# EasyEDA Pro project Orion S4 Schematic.epro

# Schematic Schematic1
Board Name: Board1; Create Date: 2026-10-31; Page Name: P1; Project Name: Orion S4 (3); Schematic Name: Schematic1; Update Date: 2026-10-31; Company: Orion; Page Size: A4; Version: V1.0
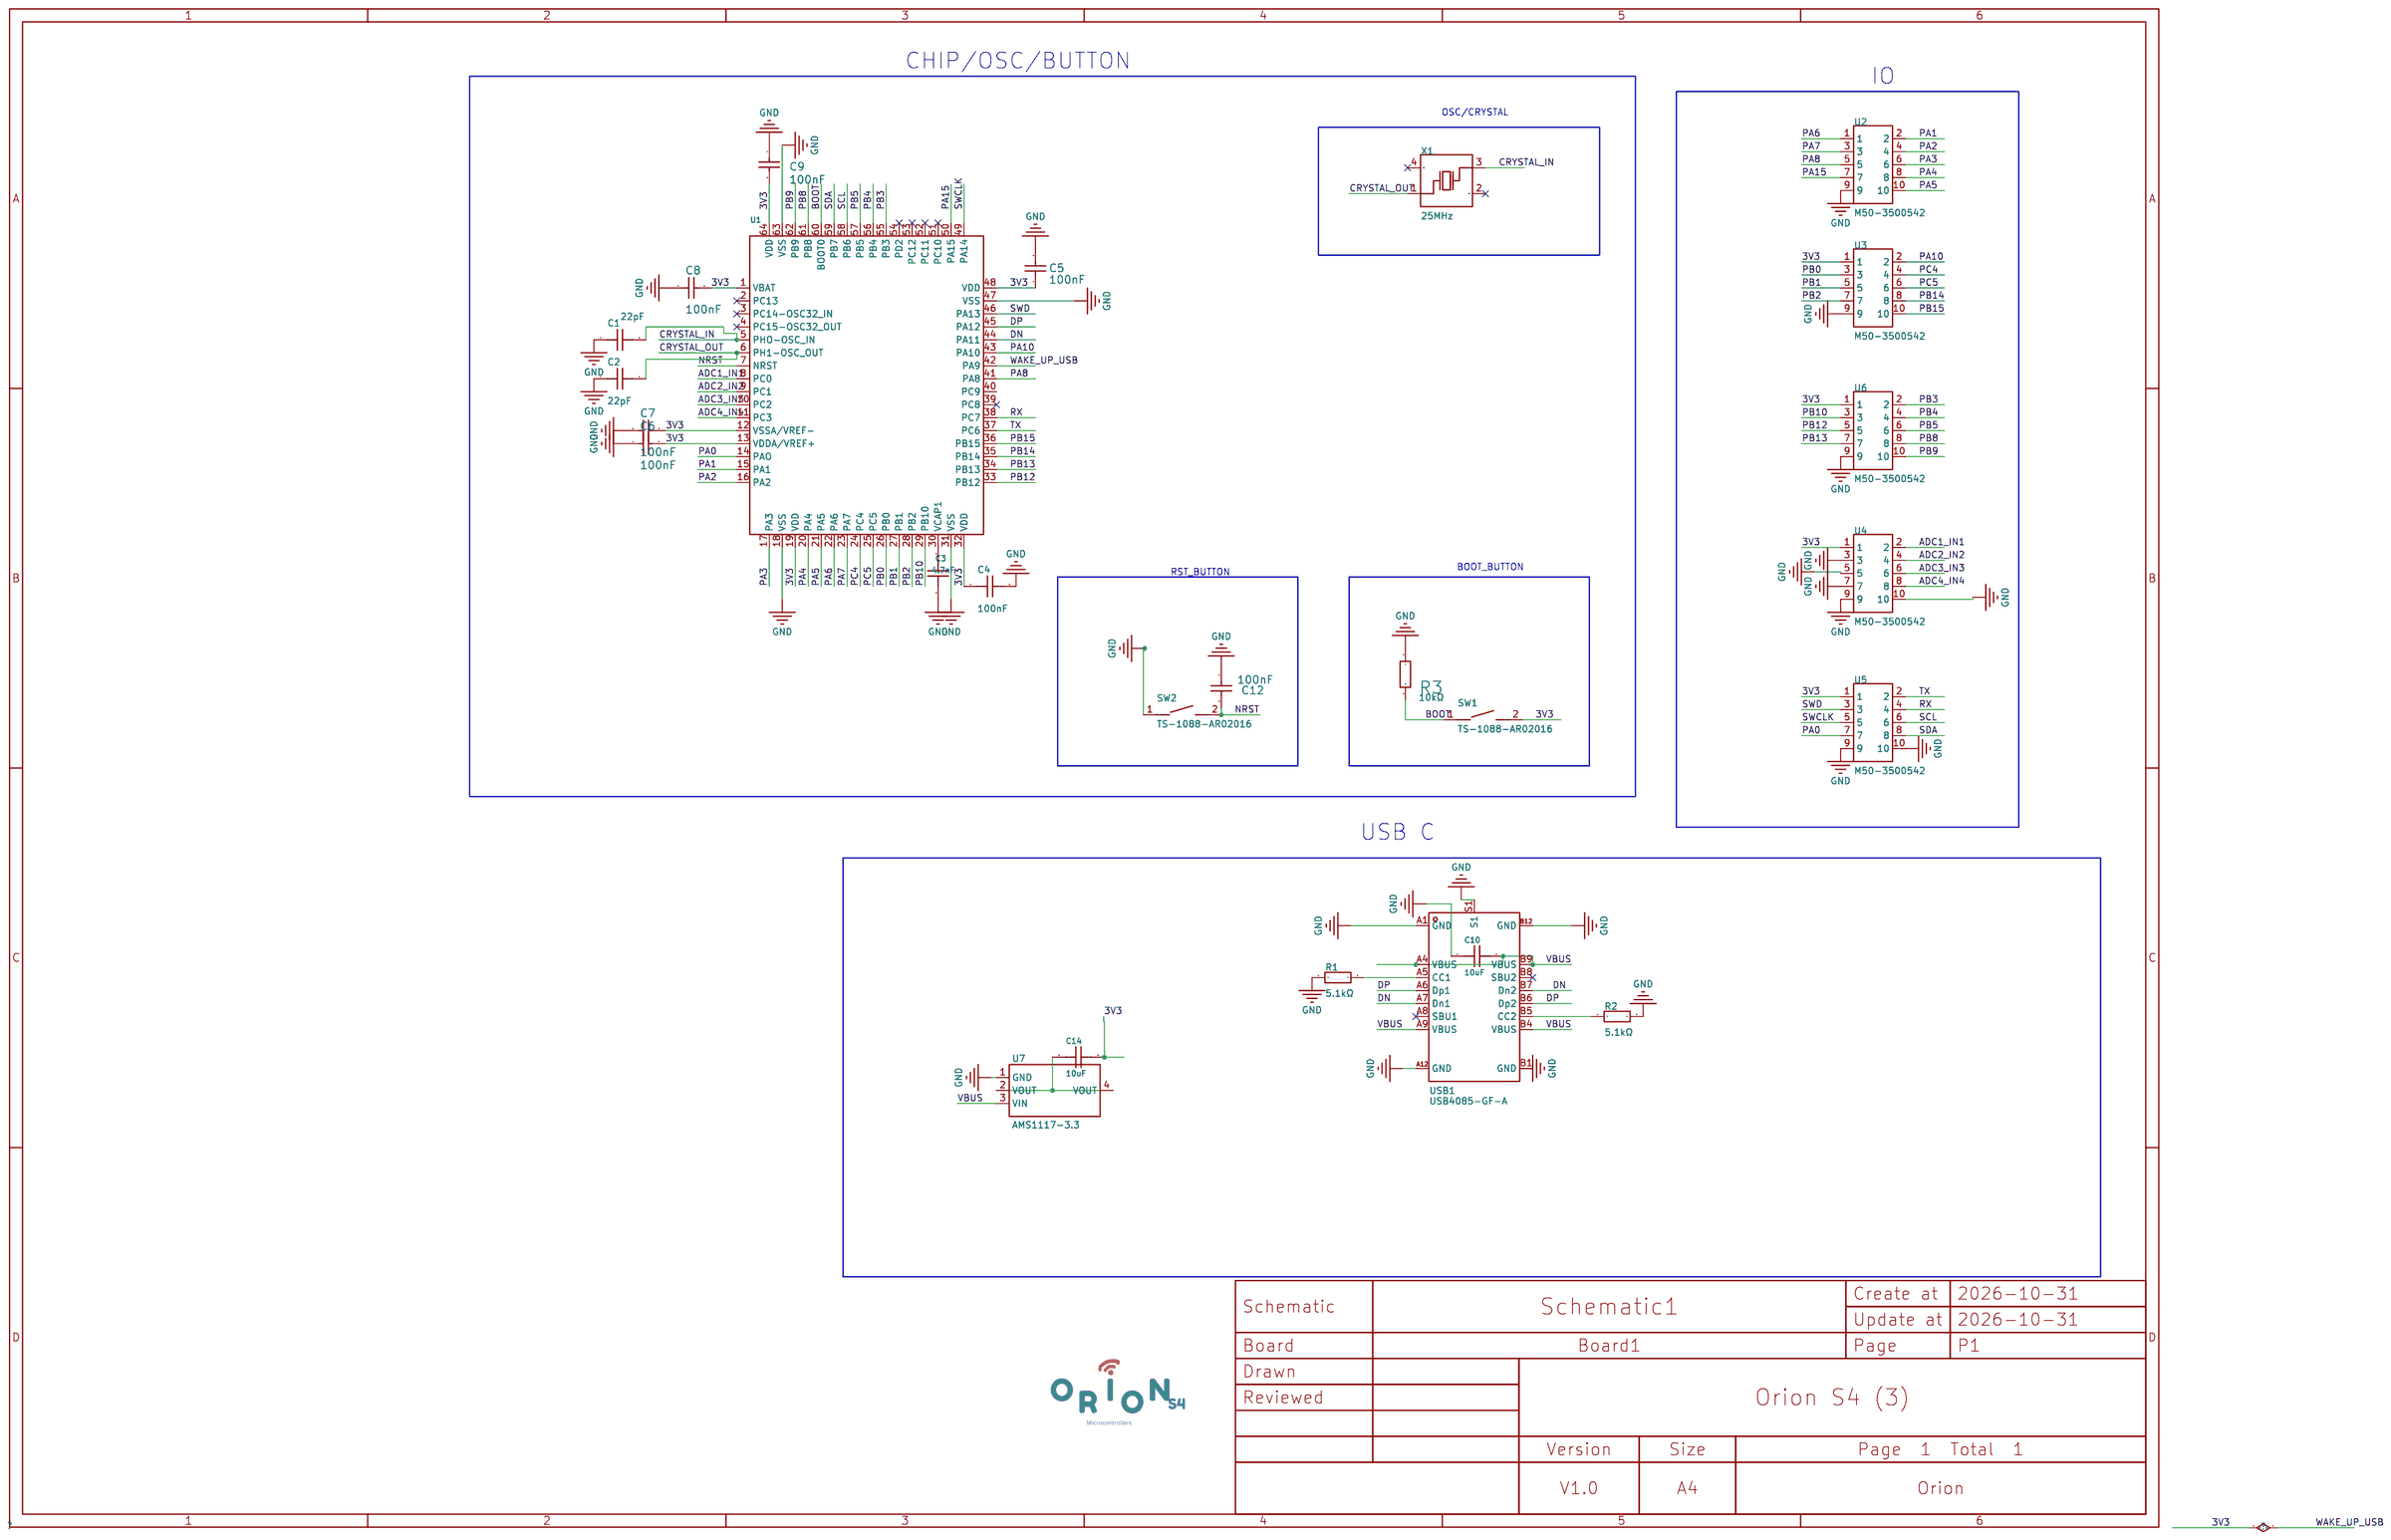
[diagram p0: schematic sheet]

## Parts
C1  22pF  [C0603]
C2  22pF  [C0603]
C3  4.7nF  [C0603]
C4  100nF  [C0805]
C5  100nF  [C0402]
C6  100nF  [C0402]
C7  100nF  [C0402]
C8  100nF  [C0402]
C9  100nF  [C0402]
C10  10uF  [C0805]
C12  100nF  [C0402]
C14  10uF  [C0805]
R1  5.1kΩ  [R0603]
R2  5.1kΩ  [R0603]
R3  10kΩ  [R0603]
SW1  TS-1088-AR02016  [SW-SMD_L3.9-W3.0-P4.45]
SW2  TS-1088-AR02016  [SW-SMD_L3.9-W3.0-P4.45]
U1  STM32F401RET6  [LQFP-64_L10.0-W10.0-P0.50-LS12.0-BL]
U2  M50-3500542  [HDR-TH_10P-P1.27-V-M-R2-C5-S1.27-1]
U3  M50-3500542  [HDR-TH_10P-P1.27-V-M-R2-C5-S1.27-1]
U4  M50-3500542  [HDR-TH_10P-P1.27-V-M-R2-C5-S1.27-1]
U5  M50-3500542  [HDR-TH_10P-P1.27-V-M-R2-C5-S1.27-1]
U6  M50-3500542  [HDR-TH_10P-P1.27-V-M-R2-C5-S1.27-1]
U7  AMS1117-3.3  [SOT-223-3_L6.5-W3.4-P2.30-LS7.0-BR]
USB1  USB4085-GF-A  [USC-C-SMD_USB4085-GF-A]
X1  25MHz  [CRYSTAL-SMD_4P-L3.2-W2.5-BL]

## Library data of the parts
C1 C2 = CL10C220JB8NNNC: Capacitance:22pF Tolerance:±5% Tolerance:±5% Voltage Rating:50V Temperature Coefficient:C0G; LCSC Part Name: 22pF ±5% 50V; Supplier Part: C1653; Manufacturer: SAMSUNG(三星); Supplier Footprint: 0603; JLCPCB Part Class: Basic Part; Datasheet: https://item.szlcsc.com/datasheet/CL10C220JB8NNNC/2005.html; Supplier: LCSC; Tolerance: ±5%; Voltage Rating: 50V; Temperature Coefficient: C0G
C3 = CML0603X7R472KT50V: Capacitance:4.7nF Tolerance:±10% Tolerance:±10% Voltage Rating:50V Temperature Coefficient:X7R; LCSC Part Name: 4.7nF ±10% 50V; Supplier Part: C3903178; Manufacturer: SEI(Stackpole Electronics Inc.); Supplier Footprint: 0603; JLCPCB Part Class: Extended Part; Datasheet: https://item.szlcsc.com/datasheet/CML0603X7R472KT50V/4471710.html; Supplier: LCSC; Tolerance: ±10%; Voltage Rating: 50V; Temperature Coefficient: X7R
C4 = C0805X104K101T_C701319: Capacitance:100nF Tolerance:±10% Tolerance:±10% Voltage Rating:100V Temperature Coefficient:X7R; LCSC Part Name: 100nF ±10% 100V; Supplier Part: C701319; Manufacturer: IHHEC(禾伸堂); Manufacturer Part: C0805X104K101T; Supplier Footprint: 0805; JLCPCB Part Class: Extended Part; Datasheet: https://item.szlcsc.com/datasheet/C0805X104K101T/736255.html; Supplier: LCSC; Tolerance: ±10%; Voltage Rating: 100V; Temperature Coefficient: X7R
C5-C9 C12 = GCM155R71H104KE02D: Supplier: LCSC; Manufacturer: muRata(村田); Supplier Part: C85858; JLCPCB Part Class: Extended Part
C10 C14 = CSA0805X5R106K250MT: Capacitance:10uF Tolerance:±10% Tolerance:±10% Voltage Rating:25V Temperature Coefficient:X5R; LCSC Part Name: 10uF ±10% 25V; Supplier Part: C20070397; Manufacturer: HRE(芯声); Supplier Footprint: 0805; JLCPCB Part Class: Extended Part; Datasheet: https://item.szlcsc.com/datasheet/CSA0805X5R106K250MT/21398659.html; Supplier: LCSC; Tolerance: ±10%; Voltage Rating: 25V; Temperature Coefficient: X5R
R1 R2 = 0603WAF5101T5E: Type:Thick Film Resistor Resistance:5.1kΩ Tolerance:±1% Tolerance:±1% Power(Watts):100mW Voltage-Supply(Max):75V Temperature Coefficient:±100ppm/℃ Temperature Coefficient:±100ppm/℃ Operating Temperature:-55℃~+155℃ Operating Temperature:-55℃~+155℃; LCSC Part Name: 厚膜电阻 5.1kΩ ±1%; Supplier Part: C23186; Manufacturer: UNI-ROYAL(厚声); Supplier Footprint: 0603; JLCPCB Part Class: Basic Part; Datasheet: https://item.szlcsc.com/datasheet/0603WAF5101T5E/23913.html; Supplier: LCSC; Type: Thick Film Resistor; Tolerance: ±1%; Power(Watts): 100mW; Voltage-Supply(Max): 75V; Temperature Coefficient: ±100ppm/℃; Operating Temperature: -55℃~+155℃
R3 = 0603WAF1002T5E: Type:Thick Film Resistor Resistance:10kΩ Tolerance:±1% Tolerance:±1% Power(Watts):100mW Voltage-Supply(Max):75V Temperature Coefficient:±100ppm/℃ Temperature Coefficient:±100ppm/℃ Operating Temperature:-55℃~+155℃ Operating Temperature:-55℃~+155℃; LCSC Part Name: 厚膜电阻 10kΩ ±1% 100mW; Supplier Part: C25804; Manufacturer: UNI-ROYAL(厚声); Supplier Footprint: 0603; JLCPCB Part Class: Basic Part; Datasheet: https://item.szlcsc.com/datasheet/0603WAF1002T5E/26547.html; Supplier: LCSC; Type: Thick Film Resistor; Tolerance: ±1%; Power(Watts): 100mW; Voltage-Supply(Max): 75V; Temperature Coefficient: ±100ppm/℃; Operating Temperature: -55℃~+155℃
SW1 SW2 = TS-1088-AR02016: Circuit:SPST Actuator Style:Round Button Operating Force:1.6N Mounting Type:Surface Mount,Vertical Length:3.9mm Width:3mm Switch Height:2mm with Bracket:Without Bracket Contact Current:50mA Voltage Rating:12V Actuator/Cap Color:Black With Lamp:- IP Rating; LCSC Part Name: 3.9*3*2mm 立贴 轻触开关; Supplier Part: C720477; Manufacturer: XUNPU(讯普); Supplier Footprint: SMD,4x3mm; JLCPCB Part Class: Basic Part; Datasheet: https://item.szlcsc.com/datasheet/TS-1088-AR02016/763484.html; Supplier: LCSC; Circuit: SPST; Actuator Style: Round Button; Operating Force: 1.6N; Mounting Type: Surface Mount,Vertical; Length: 3.9mm; Width: 3mm; Switch Height: 2mm; with Bracket: Without Bracket; Contact Current: 50mA; Voltage Rating: 12V; Actuator/Cap Color: Black; Termination Style: SMD(SMT) Tab; Life: 100,000 cycles; Operating Temperature: -30℃~+80℃
U1 = STM32F401RET6_C882044: Supplier Part: C882044; Manufacturer: ST(意法半导体); Supplier Footprint: LQFP-64(10x10); JLCPCB Part Class: Extended Part; Datasheet: https://item.szlcsc.com/datasheet/STM32F401RET6/945870.html; Supplier: LCSC
U2-U6 = M50-3500542: Pin Structure:2x5P Pitch:1.27mm Row Spacing:1.27mm Circluar Pins/Square Pins:Square pin Mounting Type:Through Hole Number of Rows:2 Number of Pins:10P Current Rating:1A Length of Mating Pin:3mm Insulation Height:1mm Length of End Connection Pin:2.3mm Cont; LCSC Part Name: 2x5P 间距:1.27mm 方针 直插; Supplier Part: C5199909; Manufacturer: Harwin; Supplier Footprint: 插件,P=1.27mm; JLCPCB Part Class: Extended Part; Datasheet: https://item.szlcsc.com/datasheet/M50-3500542/5886049.html; Supplier: LCSC; Pin Structure: 2x5P; Pitch: 1.27mm; Row Spacing: 1.27mm; Circluar Pins/Square Pins: Square pin; Mounting Type: Through Hole; Number of Rows: 2; Number of Pins: 10P; Current Rating: 1A; Length of Mating Pin: 3mm; Insulation Height: 1mm; Length of End Connection Pin: 2.3mm; Contact Material: Copper alloy; Contact Plating: Tin; Operating Temperature: -40℃~+105℃; Color: Black
U7 = AMS1117-3.3_C6186: Output Configuration:Positive Voltage - Supply:15V Output Voltage:3.3V Output Voltage:3.3V Output Current:1A Power Supply Rejection Ratio (PSRR):72dB@(120Hz) Voltage Dropout:1.1V@(800mA) standby current:5mA Noise:0.003%Vout Features:Short Circuit Protecti; LCSC Part Name: 3.3V 1A 15V; Supplier Part: C6186; Manufacturer: Advanced Monolithic Systems; Supplier Footprint: SOT-223; JLCPCB Part Class: Basic Part; Datasheet: https://item.szlcsc.com/datasheet/AMS1117-3.3/6652.html; Supplier: LCSC; Output Configuration: Positive; Voltage - Supply: 15V; Output Voltage: 3.3V; Output Current: 1A; Power Supply Rejection Ratio (PSRR): 72dB@(120Hz); Voltage Dropout: 1.1V@(800mA); standby current: 5mA; Noise: 0.003%Vout; Features: Short Circuit Protection；Thermal shutdown；Over Current Protection; Operating Temperature: -40℃~+125℃; Output Type: Fixed; Number of Outputs: 1
USB1 = USB4085-GF-A_C7095263: Connector Type:Type-C Protocol Standard:USB 2.0 Gender:Female Mounting Type:Right Angle Number of Ports:1 Current Rating-Power:5A Voltage Rating:48V Detection color:Black Operating Temperature:-40℃~+85℃ Operating Temperature:-40℃~+85℃; LCSC Part Name: Type-C 母 弯插; Supplier Part: C7095263; Manufacturer: GCT; Supplier Footprint: 插件; JLCPCB Part Class: Extended Part; Datasheet: https://item.szlcsc.com/datasheet/USB4085-GF-A/8061907.html; Supplier: LCSC; Connector Type: Type-C; Protocol Standard: USB 2.0; Gender: Female; Mounting Type: Right Angle; Number of Ports: 1; Current Rating-Power: 5A; Voltage Rating: 48V; Detection color: Black; Operating Temperature: -40℃~+85℃
X1 = X322525MOB4SI: Type:Crystal Oscillator Frequency:25MHz Normal temperature Frequency Tolerance:±10ppm Normal temperature Frequency Tolerance:±10ppm Load Capacitance:12pF Frequency Stability:±20ppm Frequency Stability:±20ppm Equivalent Series Resistance(ESR):50Ω Operating; LCSC Part Name: YSX321SL 25MHZ 4P 3225 12PF ±10PPM -40~85℃ (±20PPM); Supplier Part: C9006; Manufacturer: YXC(扬兴晶振); Supplier Footprint: SMD3225-4P; JLCPCB Part Class: Basic Part; Datasheet: https://item.szlcsc.com/datasheet/X322525MOB4SI/9526.html; Supplier: LCSC; Type: Crystal Oscillator; Normal temperature Frequency Tolerance: ±10ppm; Load Capacitance: 12pF; Frequency Stability: ±20ppm; Equivalent Series Resistance(ESR): 50Ω; Operating Temperature: -40℃~+85℃

## Nets
3V3: C4.1 C5.1 C6.2 C7.2 C8.2 C9.2 C14.2 SW1.2 U1.1(VBAT) U1.12(VSSA/VREF-) U1.13(VDDA/VREF+) U1.19(VDD) U1.32(VDD) U1.42(PA9) U1.48(VDD) U1.64(VDD) U3.1 U4.1 U5.1 U6.1
GND: C1.1 C2.1 C3.1 C4.2 C5.2 C6.1 C7.1 C8.1 C9.1 C12.1 R1.1 R2.2 R3.1 SW2.1 U1.18(VSS) U1.31(VSS) U1.47(VSS) U1.63(VSS) U2.9 U3.9 U4.3 U4.5 U4.7 U4.9 U4.10 U5.9 U5.10 U6.9 U7.1(GND) USB1.A1(GND) USB1.A12(GND) USB1.B1(GND) USB1.B12(GND) USB1.S1
VBUS: C10.2 U7.3(VIN) USB1.A4(VBUS) USB1.A9(VBUS) USB1.B4(VBUS) USB1.B9(VBUS)
ADC1_IN1: U1.8(PC0) U4.2
ADC2_IN2: U1.9(PC1) U4.4
ADC3_IN3: U1.10(PC2) U4.6
ADC4_IN4: U1.11(PC3) U4.8
BOOT: R3.2 SW1.1 U1.60(BOOT0)
CRYSTAL_IN: C1.2 U1.5(PHO-OSC_IN) X1.3(OSC2)
CRYSTAL_OUT: C2.2 U1.6(PH1-OSC_OUT) X1.1(OSC1)
DN: U1.44(PA11) USB1.A7(Dn1) USB1.B7(Dn2)
DP: U1.45(PA12) USB1.A6(Dp1) USB1.B6(Dp2)
NRST: C12.2 SW2.2 U1.7(NRST)
PA0: U1.14(PAO) U5.7
PA1: U1.15(PA1) U2.2
PA2: U1.16(PA2) U2.4
PA3: U1.17(PA3) U2.6
PA4: U1.20(PA4) U2.8
PA5: U1.21(PA5) U2.10
PA6: U1.22(PA6) U2.1
PA7: U1.23(PA7) U2.3
PA8: U1.41(PA8) U2.5
PA10: U1.43(PA10) U3.2
PA15: U1.50(PA15) U2.7
PB0: U1.26(PB0) U3.3
PB1: U1.27(PB1) U3.5
PB2: U1.28(PB2) U3.7
PB3: U1.55(PB3) U6.2
PB4: U1.56(PB4) U6.4
PB5: U1.57(PB5) U6.6
PB8: U1.61(PB8) U6.8
PB9: U1.62(PB9) U6.10
PB10: U1.29(PB10) U6.3
PB12: U1.33(PB12) U6.5
PB13: U1.34(PB13) U6.7
PB14: U1.35(PB14) U3.8
PB15: U1.36(PB15) U3.10
PC4: U1.24(PC4) U3.4
PC5: U1.25(PC5) U3.6
RX: U1.38(PC7) U5.4
SCL: U1.58(PB6) U5.6
SDA: U1.59(PB7) U5.8
SWCLK: U1.49(PA14) U5.5
SWD: U1.46(PA13) U5.3
TX: U1.37(PC6) U5.2
Net-(C3-2): C3.2 U1.30(VCAP1)
Net-(C14-1): C14.1 U7.2(VOUT) U7.4(VOUT)
Net-(R1-2): R1.2 USB1.A5(CC1)
Net-(R2-1): R2.1 USB1.B5(CC2)

Not connected (* = marked no-connect by the designer): C10 1; U1 2(PC13)* 3(PC14-OSC32_IN)* 4(PC15-OSC32_OUT)* 39(PC8)* 40(PC9) 51(PC10)* 52(PC11)* 53(PC12)* 54(PD2)*; USB1 A8(SBU1)* B8(SBU2)*; X1 2(GND)* 4(GND)*

## Notes on the sheet
- CHIP/OSC/BUTTON
- IO
- OSC/CRYSTAL
- RST_BUTTON
- BOOT_BUTTON
- USB C
